# Altium schematic sheet DebugBoardMuxes.SchDoc
size 420 x 297 mm; SheetNumber: 2; SheetTotal: 2
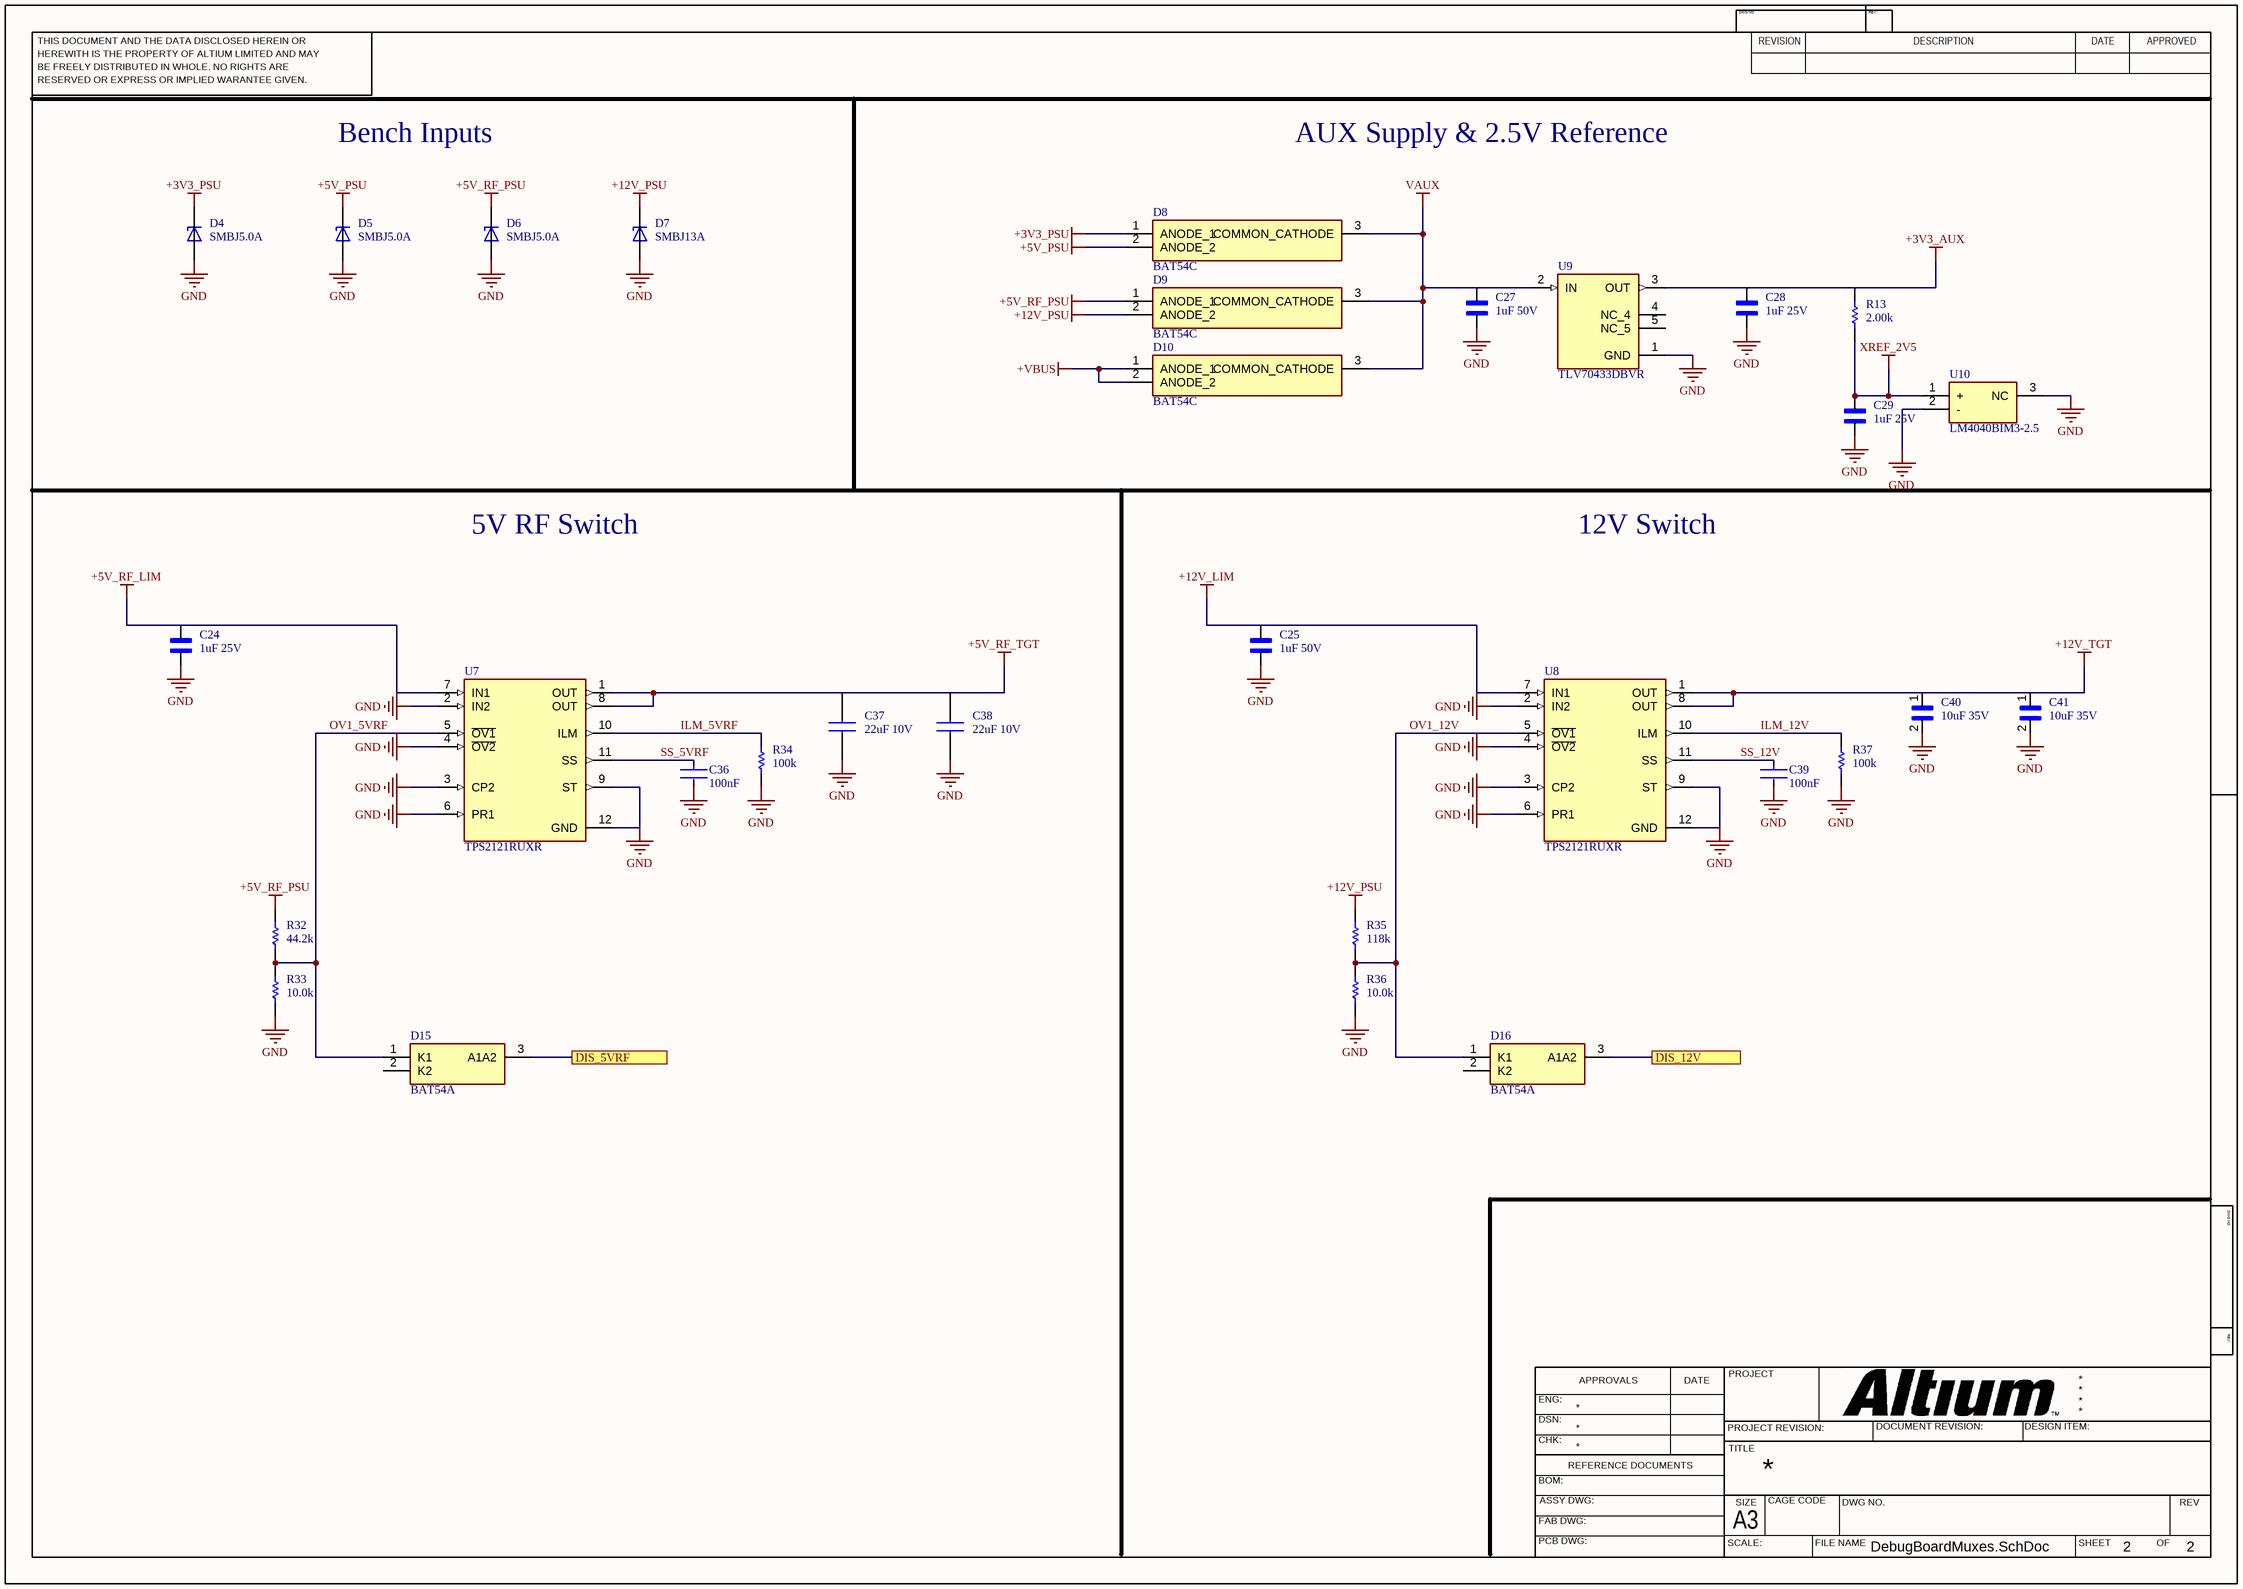
[diagram p0: DebugBoardMuxes.SchDoc]

## Parts
C24  1uF 25V  [CAPC2012X135N]
C25  1uF 50V  [CAPC2012X135N]
C27  1uF 50V  [CAPC2012X135N]
C28  1uF 25V  [CAPC2012X135N]
C29  1uF 25V  [CAPC2012X135N]
C36  100nF  [FP-C0805C-DN-MFG]
C37  22uF 10V  [CAPC3116X180N]
C38  22uF 10V  [CAPC3116X180N]
C39  100nF  [FP-C0805C-DN-MFG]
C40  10uF 35V  [CAPC3216X190N]
C41  10uF 35V  [CAPC3216X190N]
D4  SMBJ5.0A  [DIOM4336X265N]
D5  SMBJ5.0A  [DIOM4336X265N]
D6  SMBJ5.0A  [DIOM4336X265N]
D7  SMBJ13A  [DIOM4336X265N]
D8  BAT54C  [BAT54C215]
D9  BAT54C  [BAT54C215]
D10  BAT54C  [BAT54C215]
D15  BAT54A  [SOT95P230X110-3N]
D16  BAT54A  [SOT95P230X110-3N]
R13  2.00k  [RES_0805]
R32  44.2k  [RES_0805]
R33  10.0k  [RES_0805]
R34  100k  [RES_0805]
R35  118k  [RES_0805]
R36  10.0k  [RES_0805]
R37  100k  [RES_0805]
U7  TPS2121RUXR  [FP-RUX0012A-MFG]
U8  TPS2121RUXR  [FP-RUX0012A-MFG]
U9  TLV70433DBVR  [SOT95P280X145-5N]
U10  LM4040BIM3-2.5  [SOT95P237X112-3N]

## Ports
DIS_5VRF, DIS_12V

## Nets
+3V3_AUX: C28.1 R13.1 U9.3(OUT)
+3V3_PSU: D4.C D8.1(ANODE_1)
+5V_PSU: D5.C D8.2(ANODE_2)
+5V_RF_LIM: C24.1 U7.7(IN1)
+5V_RF_PSU: D6.C D9.1(ANODE_1) R32.1
+5V_RF_TGT: C37.1 C38.1 U7.1(OUT) U7.8(OUT)
+12V_LIM: C25.1 U8.7(IN1)
+12V_PSU: D7.C D9.2(ANODE_2) R35.1
+12V_TGT: C40.1 C41.1 U8.1(OUT) U8.8(OUT)
+VBUS: D10.1(ANODE_1) D10.2(ANODE_2)
GND: C24.2 C25.2 C27.2 C28.2 C29.2 C36.2 C37.2 C38.2 C39.2 C40.2 C41.2 D4.A D5.A D6.A D7.A R33.2 R34.2 R36.2 R37.2 U7.2(IN2) U7.3(CP2) U7.4(~{OV2}) U7.6(PR1) U7.9(ST) U7.12(GND) U8.2(IN2) U8.3(CP2) U8.4(~{OV2}) U8.6(PR1) U8.9(ST) U8.12(GND) U9.1(GND) U10.2(-) U10.3(NC)
VAUX: C27.1 D8.3(COMMON_CATHODE) D9.3(COMMON_CATHODE) D10.3(COMMON_CATHODE) U9.2(IN)
XREF_2V5: C29.1 R13.2 U10.1(+)
DIS_5VRF: D15.3(A1A2) ; port DIS_5VRF
DIS_12V: D16.3(A1A2) ; port DIS_12V
ILM_5VRF: R34.1 U7.10(ILM)
ILM_12V: R37.1 U8.10(ILM)
OV1_5VRF: D15.1(K1) R32.2 R33.1 U7.5(~{OV1})
OV1_12V: D16.1(K1) R35.2 R36.1 U8.5(~{OV1})
SS_5VRF: C36.1 U7.11(SS)
SS_12V: C39.1 U8.11(SS)

Not connected (* = marked no-connect by the designer): D15 2(K2); D16 2(K2); U9 4(NC_4) 5(NC_5)

## Notes on the sheet
- Bench Inputs
- AUX Supply & 2.5V Reference
- 5V RF Switch
- 12V Switch
- THIS DOCUMENT AND THE DATA DISCLOSED HEREIN OR
- HEREWITH IS THE PROPERTY OF ALTIUM LIMITED AND MAY
- DWG NO:
- REVISION
- REV:
- DESCRIPTION
- DATE
- APPROVED
- BE FREELY DISTRIBUTED IN WHOLE. NO RIGHTS ARE
- RESERVED OR EXPRESS OR IMPLIED WARANTEE GIVEN.
- ENG:
- APPROVALS
- PROJECT
- DSN:
- CHK:
- REFERENCE DOCUMENTS
- PROJECT REVISION:
- TITLE
- DOCUMENT REVISION:
- DESIGN ITEM:
- BOM:
- FAB DWG:
- PCB DWG:
- ASSY DWG:
- SCALE:
- A3
- SIZE
- CAGE CODE
- FILE NAME
- DWG NO.
- SHEET
- OF
- REV

## Library data of the parts
C24 C28 C29 = CL21B105KAFNNNE: 1 ÂµF Â±10% 25V Ceramic Capacitor X7R 0805 (2012 Metric); MF: Samsung Electro-Mechanics; SnapEDA_Link: https://www.snapeda.com/parts/CL21B105KAFNNNE/Samsung/view-part/?ref=snap; Package: SMD-2 Samsung; Value: 1uF 25V; MP: CL21B105KAFNNNE; Check_prices: https://www.snapeda.com/parts/CL21B105KAFNNNE/Samsung/view-part/?ref=eda
C25 C27 = GRM21BR71H105KA12L: SMD Capacitor X7R(EIA) with Capacitance: 1.0uF Tol. 10%. Rated Voltage: 50Vdc; MF: Murata; SnapEDA_Link: https://www.snapeda.com/parts/GRM21BR71H105KA12L/Murata/view-part/?ref=snap; Package: 805-2 Murata; Value: 1uF 50V; MP: GRM21BR71H105KA12L; Check_prices: https://www.snapeda.com/parts/GRM21BR71H105KA12L/Murata/view-part/?ref=eda
C36 C39 = CMP-03020-000950-1: CAP CER 0.1UF 50V X7R 0805; Manufacturer: KEMET; Manufacturer Part Number: C0805C104J5RACTU; Temperature Coefficient: 30ppm/°C; Value: 0.10 μF; Material: Ceramic; Tolerance: 0.05; Voltage Rating: 50 V; Digikey Description: CAP CER 0.1UF 50V X7R 0805; Octopart: https://octopart.com/c0805c104j5ractu-kemet-104634; RoHS: TRUE; Device Class L1: Passive Components; Temperature Characteristic: X7R; Device Class L3: Ceramic Capacitors; Lead Free: Yes; Automotive: No; Category: Cap; Temperature: -55°C to +125°C; Package: C0805C-DN; Temperature Range High: +125°C; Height: 0.88mm; Capacitance: 0.10 μF; Temperature Range Low: -55°C; ComponentLink2Description: Datasheet; ComponentLink2URL: https://content.kemet.com/datasheets/KEM_C1003_C0G_SMD.pdf; Ipc Land Pattern Name: CAPC200125X78; Device Class L2: Capacitors; Mouser Description: Multilayer Ceramic Capacitors MLCC - SMD/SMT 50volts 0.1uF X7R 5%
C37 C38 = GCM31CR71A226KE02K: Capacitor GCM31 L=3.2mm W=1.6mm T=1.6mm; Manufacturer_Name: Murata Electronics; Geometry.Height: 1.8mm; Manufacturer_Part_Number: GCM31CR71A226KE02K; Mouser Part Number: 81-GCM31CR71A226KE2K; Mouser Price/Stock: https://www.mouser.co.uk/ProductDetail/Murata-Electronics/GCM31CR71A226KE02K?qs=QzBtWTOodeVgM6QlH6X51g%3D%3D; Arrow Part Number: GCM31CR71A226KE02K; Arrow Price/Stock: https://www.arrow.com/en/products/gcm31cr71a226ke02k/murata-manufacturing?region=nac; Datasheet Link: https://search.murata.co.jp/Ceramy/image/img/A01X/G101/ENG/GCM31CR71A226KE02-01A.pdf
C40 C41 = CGA5L1X7R1V106K160AE: 10 ÂµF Â±10% 35V é™¶ç“·ç”µå®¹å™¨ X7R 1206ï¼ˆ3216 å…¬åˆ¶ï¼‰; MF: TDK; Package: 3216 TDK; Price: None; Check_prices: https://www.snapeda.com/parts/CGA5L1X7R1V106K160AE/TDK/view-part/?ref=eda; Value: 10uF 35V; SnapEDA_Link: https://www.snapeda.com/parts/CGA5L1X7R1V106K160AE/TDK/view-part/?ref=snap; MP: CGA5L1X7R1V106K160AE; Availability: In Stock; Purchase-URL: https://pricing.snapeda.com/search/part/CGA5L1X7R1V106K160AE/?ref=eda
D4-D6 = SMBJ5.0A: TVS, 600 W, 5.0 V stand-off, 6.40-7.00 V breakdown, 9.2 V clamp, unidirectional, SMB; MF: Littelfuse; SnapEDA_Link: https://www.littelfuse.com/assetdocs/littelfuse-tvs-diode-smbj-datasheet; Package: SMB (DO-214AA); Value: SMBJ5.0A; MP: SMBJ5.0A; Check_prices: https://www.digikey.com/en/products/result?keywords=SMBJ5.0A%20Littelfuse
D7 = SMBJ13A: 600W, 15.2V, 5%, Unidirectional, TVS; MF: Taiwan Semiconductor Corporation; SnapEDA_Link: https://www.snapeda.com/parts/SMBJ13A/taiwan/view-part/?ref=snap; Package: SMD-2 Taiwan Semiconductor; Value: SMBJ13A; MP: SMBJ13A; Check_prices: https://www.snapeda.com/parts/SMBJ13A/taiwan/view-part/?ref=eda
D8-D10 = BAT54C_215: Schottky barrier diode,BAT54C 0.2A 30V NXP BAT54C,215, Dual SMT Schottky Diode, Common Cathode, 30V 200mA, 5ns, 3-Pin TO-236AB; Manufacturer_Name: Nexperia; Geometry.Height: 1.1mm; Manufacturer_Part_Number: BAT54C,215; Mouser Part Number: 771-BAT54C-T/R; Mouser Price/Stock: https://www.mouser.co.uk/ProductDetail/Nexperia/BAT54C215?qs=me8TqzrmIYV5SKKt13YKQA%3D%3D; Arrow Part Number: BAT54C,215; Arrow Price/Stock: https://www.arrow.com/en/products/bat54c215/nexperia.html?utm_currency=USD&region=asia; Datasheet Link: https://assets.nexperia.com/documents/data-sheet/BAT54_SER.pdf
D15 D16 = BAT54A_215: Diode Array 1 Pair Common Anode 30 V 200mA (DC) Surface Mount TO-236-3, SC-59, SOT-23-3; Manufacturer_Name: Nexperia; Manufacturer_Part_Number: BAT54A,215; Geometry.Height: 1.1mm; Mouser Part Number: 771-BAT54A-T/R; Mouser Price/Stock: https://www.mouser.co.uk/ProductDetail/Nexperia/BAT54A215?qs=me8TqzrmIYV%252BITv%2F8aeieg%3D%3D; Arrow Part Number: BAT54A,215; Arrow Price/Stock: https://www.arrow.com/en/products/bat54a215/nexperia.html?utm_currency=USD&region=europe; Datasheet Link: https://assets.nexperia.com/documents/data-sheet/BAT54A.pdf
R13 R32-R37 = CMP-009-00183-1: Resistor SMD 0805 - Generic; Source: Generic_Schematic_Library.SchLib; Design Item ID: RES_0805
U7 U8 = CMP-019-00076-1: 2.7-V to 22-V, 56-mΩ, 4.5-A, power mux with seamless switchover 12-VQFN-HR -40 to 125; Min Supply Voltage: 2.8V; Max Supply Voltage: 22V; Nominal Supply Current: 300µA; Max Operating Temperature: 125°C; Output Voltage: 22V; Pins: 12; Min Operating Temperature: -40°C
U9 = TLV70433DBVR: 150-mA 24-V ultra-low-IQ low-dropout (LDO) voltage regulator; MF: Texas Instruments; SnapEDA_Link: https://www.snapeda.com/parts/TLV70433DBVR/Texas+Instruments/view-part/?ref=snap; Package: SOT-23-5 Texas Instruments; Value: TLV70433DBVR; MP: TLV70433DBVR; Check_prices: https://www.snapeda.com/parts/TLV70433DBVR/Texas+Instruments/view-part/?ref=eda
U10 = LM4040BIM3-2.5_NOPB: 100-ppm/C precision micropower shunt voltage reference; Manufacturer_Name: Texas Instruments; Manufacturer_Part_Number: LM4040BIM3-2.5/NOPB; Geometry.Height: 1.12mm; Mouser Part Number: 926-LM4040BIM325NOPB; Mouser Price/Stock: https://www.mouser.co.uk/ProductDetail/Texas-Instruments/LM4040BIM3-2.5-NOPB?qs=QbsRYf82W3GDmxxHwxXlYw%3D%3D; Arrow Part Number: LM4040BIM3-2.5/NOPB; Arrow Price/Stock: https://www.arrow.com/en/products/lm4040bim3-2.5nopb/texas-instruments; Datasheet Link: https://datasheet.datasheetarchive.com/originals/distributors/Datasheets-DGA16/867642.pdf